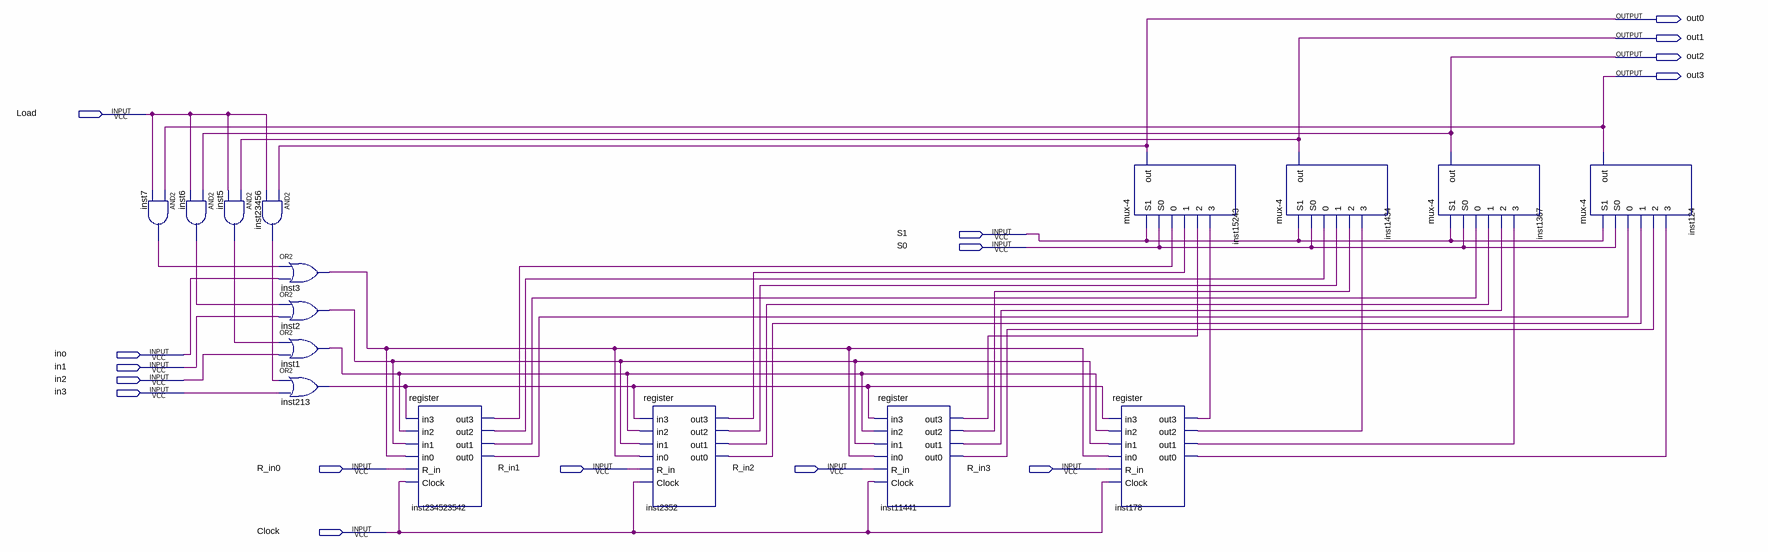
[diagram p0: schematic sheet]
// Quartus schematic 4-bit-register.bdf as structural Verilog: 16 symbols, 16 pins
module \4-bit-register  (
  input  Load,
  input  S1,
  input  S0,
  input  ino,
  input  in1,
  input  in2,
  input  in3,
  input  R_in0,
  input  R_in1,
  input  R_in2,
  input  R_in3,
  input  Clock,
  output out0,
  output out1,
  output out2,
  output out3
);

  wire inst1_out, inst2_out, inst3_out, inst5_out, inst6_out, inst7_out, inst178_out0, inst178_out1,
       inst178_out2, inst178_out3, inst213_out, inst2352_out0, inst2352_out1, inst2352_out2, inst2352_out3,
       inst11441_out0, inst11441_out1, inst11441_out2, inst11441_out3, inst23456_out, inst234523542_out0,
       inst234523542_out1, inst234523542_out2, inst234523542_out3;

  and inst6 (inst6_out, out2, Load);
  and inst7 (inst7_out, out3, Load);
  and inst5 (inst5_out, out1, Load);
  and inst23456 (inst23456_out, out0, Load);
  or inst3 (inst3_out, inst7_out, ino);
  or inst2 (inst2_out, inst6_out, in1);
  or inst1 (inst1_out, inst5_out, in2);
  or inst213 (inst213_out, inst23456_out, in3);
  register inst234523542 (
    .in3(inst213_out), .in2(inst1_out), .in1(inst2_out), .in0(inst3_out), .R_in(R_in0), .Clock(Clock),
    .out3(inst234523542_out3), .out2(inst234523542_out2), .out1(inst234523542_out1), .out0(inst234523542_out0));
  register inst2352 (
    .in3(inst213_out), .in2(inst1_out), .in1(inst2_out), .in0(inst3_out), .R_in(R_in1), .Clock(Clock),
    .out3(inst2352_out3), .out2(inst2352_out2), .out1(inst2352_out1), .out0(inst2352_out0));
  register inst11441 (
    .in3(inst213_out), .in2(inst1_out), .in1(inst2_out), .in0(inst3_out), .R_in(R_in2), .Clock(Clock),
    .out3(inst11441_out3), .out2(inst11441_out2), .out1(inst11441_out1), .out0(inst11441_out0));
  \mux-4  inst15243 (
    .S1(S1), .S0(S0), .\0 (inst234523542_out3), .\1 (inst2352_out3), .\2 (inst11441_out3),
    .\3 (inst178_out3), .out(out0));
  register inst178 (
    .in3(inst213_out), .in2(inst1_out), .in1(inst2_out), .in0(inst3_out), .R_in(R_in3), .Clock(Clock),
    .out3(inst178_out3), .out2(inst178_out2), .out1(inst178_out1), .out0(inst178_out0));
  \mux-4  inst1434 (
    .S1(S1), .S0(S0), .\0 (inst234523542_out2), .\1 (inst2352_out2), .\2 (inst11441_out2),
    .\3 (inst178_out2), .out(out1));
  \mux-4  inst1367 (
    .S1(S1), .S0(S0), .\0 (inst234523542_out1), .\1 (inst2352_out1), .\2 (inst11441_out1),
    .\3 (inst178_out1), .out(out2));
  \mux-4  inst124 (
    .S1(S1), .S0(S0), .\0 (inst234523542_out0), .\1 (inst2352_out0), .\2 (inst11441_out0),
    .\3 (inst178_out0), .out(out3));
endmodule
